# Altium schematic sheet Top_Level.SchDoc
size A4; SheetNumber: 1; SheetTotal: 9
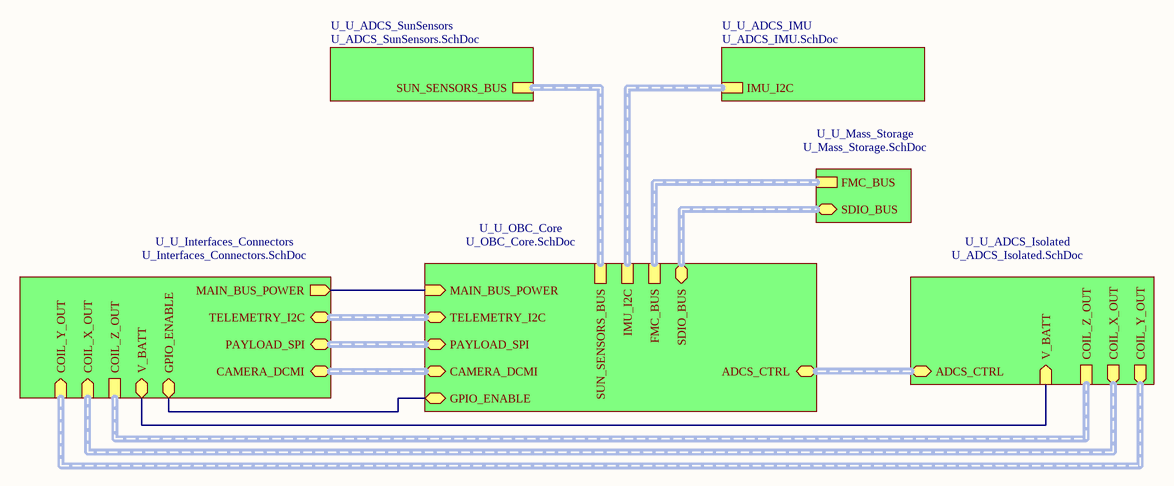
[diagram p0: Top_Level.SchDoc]

## Sub-sheets
U_U_ADCS_IMU = U_ADCS_IMU.SchDoc: IMU_I2C (harness IMU_I2C_DEF)
U_U_ADCS_Isolated = U_ADCS_Isolated.SchDoc: ADCS_CTRL (bidir, harness ADCS_CTRL_DEF), COIL_Y_OUT (out, harness COIL_Y_DEF), COIL_X_OUT (out, harness COIL_X_DEF), V_BATT (in), COIL_Z_OUT (harness COIL_Z_DEF)
U_U_ADCS_SunSensors = U_ADCS_SunSensors.SchDoc: SUN_SENSORS_BUS (harness SUN_ADC_DEF)
U_U_Interfaces_Connectors = U_Interfaces_Connectors.SchDoc: MAIN_BUS_POWER (out), TELEMETRY_I2C (bidir, harness I2C_DEF), PAYLOAD_SPI (bidir, harness PAYLOAD_SPI_TYPE), CAMERA_DCMI (bidir, harness DCMI_DEF), GPIO_ENABLE (bidir), COIL_Y_OUT (in, harness COIL_Y_DEF), COIL_X_OUT (in, harness COIL_X_DEF), V_BATT (bidir), COIL_Z_OUT (harness COIL_Z_DEF)
U_U_Mass_Storage = U_Mass_Storage.SchDoc: SDIO_BUS (bidir, harness SDIO_BUS_TYPE), FMC_BUS (harness FMC_BUS_TYPE)
U_U_OBC_Core = U_OBC_Core.SchDoc: MAIN_BUS_POWER (in), TELEMETRY_I2C (bidir, harness I2C_DEF), PAYLOAD_SPI (bidir, harness PAYLOAD_SPI_TYPE), CAMERA_DCMI (bidir, harness DCMI_DEF), ADCS_CTRL (bidir, harness ADCS_CTRL_DEF), GPIO_ENABLE (bidir), SUN_SENSORS_BUS (harness SUN_ADC_DEF), IMU_I2C (harness IMU_I2C_DEF), FMC_BUS (harness FMC_BUS_TYPE), SDIO_BUS (bidir, harness SDIO_BUS_TYPE)

## Nets
(unnamed): sheet U_U_OBC_Core/MAIN_BUS_POWER, sheet U_U_Interfaces_Connectors/MAIN_BUS_POWER
(unnamed): sheet U_U_OBC_Core/GPIO_ENABLE, sheet U_U_Interfaces_Connectors/GPIO_ENABLE
(unnamed): sheet U_U_ADCS_Isolated/V_BATT, sheet U_U_Interfaces_Connectors/V_BATT

## Buses and harness runs
harness sheet U_U_ADCS_IMU/IMU_I2C = sheet U_U_OBC_Core/IMU_I2C
harness sheet U_U_ADCS_Isolated/ADCS_CTRL = sheet U_U_OBC_Core/ADCS_CTRL
harness sheet U_U_ADCS_Isolated/COIL_X_OUT = sheet U_U_Interfaces_Connectors/COIL_X_OUT
harness sheet U_U_ADCS_Isolated/COIL_Y_OUT = sheet U_U_Interfaces_Connectors/COIL_Y_OUT
harness sheet U_U_ADCS_Isolated/COIL_Z_OUT = sheet U_U_Interfaces_Connectors/COIL_Z_OUT
harness sheet U_U_ADCS_SunSensors/SUN_SENSORS_BUS = sheet U_U_OBC_Core/SUN_SENSORS_BUS
harness sheet U_U_Interfaces_Connectors/CAMERA_DCMI = sheet U_U_OBC_Core/CAMERA_DCMI
harness sheet U_U_Interfaces_Connectors/PAYLOAD_SPI = sheet U_U_OBC_Core/PAYLOAD_SPI
harness sheet U_U_Interfaces_Connectors/TELEMETRY_I2C = sheet U_U_OBC_Core/TELEMETRY_I2C
harness sheet U_U_Mass_Storage/FMC_BUS = sheet U_U_OBC_Core/FMC_BUS
harness sheet U_U_Mass_Storage/SDIO_BUS = sheet U_U_OBC_Core/SDIO_BUS